# Altium schematic sheet LED_Section.SchDoc
size A4
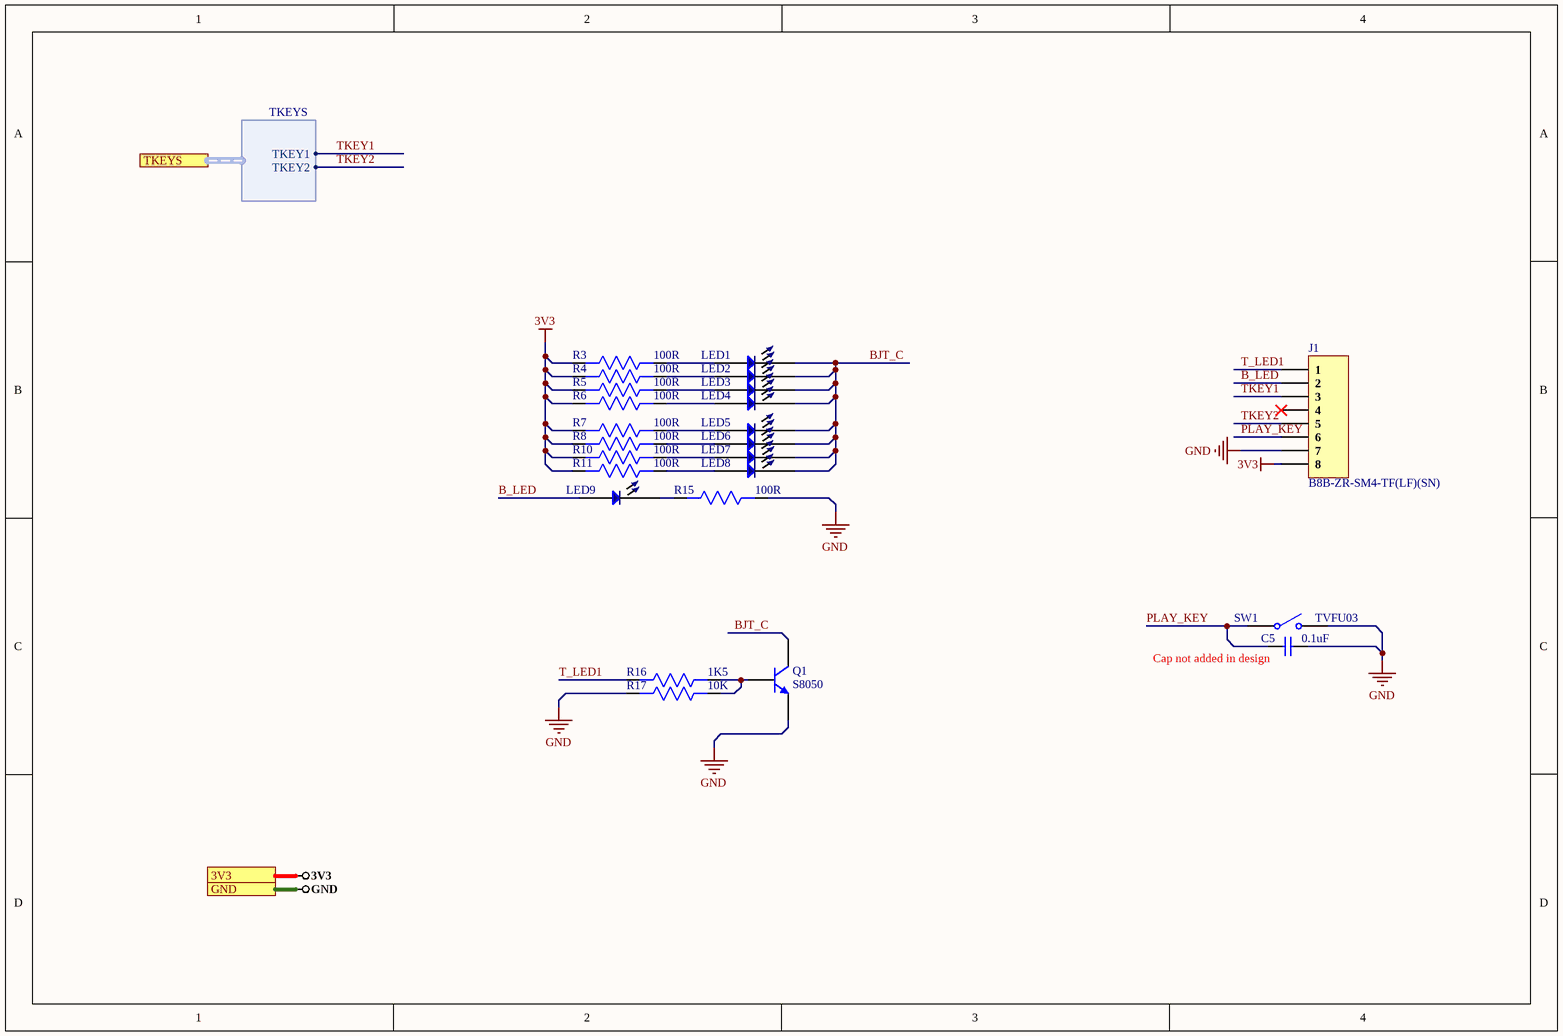
[diagram p0: LED_Section.SchDoc]

## Parts
C5  0.1uF  [Cap0805]
J1  B8B-ZR-SM4-TF(LF)(SN)  [B8B-ZR-SM4-TF(LF)(SN)]
LED1  150080GS75000  [LED 0805]  (value not drawn)
LED2  150080GS75000  [LED 0805]  (value not drawn)
LED3  150080GS75000  [LED 0805]  (value not drawn)
LED4  150080GS75000  [LED 0805]  (value not drawn)
LED5  150080GS75000  [LED 0805]  (value not drawn)
LED6  150080GS75000  [LED 0805]  (value not drawn)
LED7  150080GS75000  [LED 0805]  (value not drawn)
LED8  150080GS75000  [LED 0805]  (value not drawn)
LED9  150080GS75000  [LED 0805]  (value not drawn)
Q1  S8050  [sot-23]
R3  100R  [RES 0805]
R4  100R  [RES 0805]
R5  100R  [RES 0805]
R6  100R  [RES 0805]
R7  100R  [RES 0805]
R8  100R  [RES 0805]
R10  100R  [RES 0805]
R11  100R  [RES 0805]
R15  100R  [RES 0805]
R16  1K5  [RES 0805]
R17  10K  [RES 0805]
SW1  TVFU03  [TVFU03]

## Ports
3V3, GND, TKEYS (harness TKEYS)

## Harnesses
TKEYS: TKEY1, TKEY2

## Nets
3V3: J1.8 R3.2 R4.2 R5.2 R6.2 R7.2 R8.2 R10.2 R11.2 ; port 3V3
GND: C5.2 J1.7 Q1.2(E) R15.1 R17.2 SW1.2 ; port GND
B_LED: J1.2 LED9.1
BJT_C: LED1.2 LED2.2 LED3.2 LED4.2 LED5.2 LED6.2 LED7.2 LED8.2 Q1.3(C)
PLAY_KEY: C5.1 J1.6 SW1.1
T_LED1: J1.1 R16.2
TKEY1: J1.3 ; port TKEYS.TKEY1
TKEY2: J1.5 ; port TKEYS.TKEY2
NetLED1_1: LED1.1 R3.1
NetLED2_1: LED2.1 R4.1
NetLED3_1: LED3.1 R5.1
NetLED4_1: LED4.1 R6.1
NetLED5_1: LED5.1 R7.1
NetLED6_1: LED6.1 R8.1
NetLED7_1: LED7.1 R10.1
NetLED8_1: LED8.1 R11.1
NetLED9_2: LED9.2 R15.2
NetQ1_1: Q1.1(B) R16.1 R17.1

Not connected (* = marked no-connect by the designer): J1 4*

## Notes on the sheet
- (near C5) Cap not added in design

## Library data of the parts
C5 = 0805B104K500CT: CAP CER 0.1UF 50V X7R 0805; Manufacturer: Walsin Technologies; Tolerance: 10%; Capacitance: 100nF; Supplier 1: Digi-Key; Manufacturer Part Number: 0805B104K500CT; RoHS: Yes; Category: Ceramic Capacitors; Stock 1: 1274242; Pricing 1: 1=0.12000, 10=0.08600, 50=0.04900, 100=0.04050, 500=0.02842, 1000=0.02352 (USD); Case/Package: 0805; Case Code (Imperial): 0805; Case Code (Metric): 2012; Min Operating Temperature: -55°C; Max Operating Temperature: 125°C; Packaging: Tape and Reel; Voltage Rating: 50V; Dielectric: X7R; Voltage Rating (DC): 50V; Voltage: 50V; Length: 2mm; Depth: 1.25mm; Radiation Hardening: No; REACH SVHC: Unknown; Lead Free: Lead Free; ComponentLink1URL: http://www.farnell.com/datasheets/2340522.pdf?src-supplier=Farnell; ComponentLink1Description: http://www.farnell.com/datasheets/2340522.pdf?src-supplier=Farnell; ComponentLink2URL: http://components.arrow.com/part/dataview/0323_00650840?src-supplier=Arrow+Europe; ComponentLink2Description: http://components.arrow.com/part/dataview/0323_00650840?src-supplier=Arrow+Europe; ComponentLink3URL: https://www.verical.com/server-webapp/html/getDatasheet?partID=414849&src-supplier=Verical; ComponentLink3Description: https://www.verical.com/server-webapp/html/getDatasheet?partID=414849&src-supplier=Verical; ComponentLink4URL: http://www.farnell.com/datasheets/2340522.pdf?src-supplier=Element14; ComponentLink4Description: http://www.farnell.com/datasheets/2340522.pdf?src-supplier=Element14; ComponentLink5URL: http://www.passivecomponent.com/wp-content/uploads/2018/10/MLCC.pdf?src-supplier=Digi-Key; ComponentLink5Description: http://www.passivecomponent.com/wp-content/uploads/2018/10/MLCC.pdf?src-supplier=Digi-Key; ComponentLink6URL: http://www.passivecomponent.com/indexsea/0805B104K500CT-IB.pdf?src-supplier=Digi-Key; ComponentLink6Description: http://www.passivecomponent.com/indexsea/0805B104K500CT-IB.pdf?src-supplier=Digi-Key; ComponentLink7URL: http://www.farnell.com/datasheets/2340522.pdf?src-supplier=Newark; ComponentLink7Description: http://www.farnell.com/datasheets/2340522.pdf?src-supplier=Newark; Supplier Part Number 1: 1292-1647-1-ND
J1 = B8B-ZR-SM4-TF(LF)(SN): Conn Shrouded Header HDR 8 POS 1.5mm Solder ST SMD T/R; Manufacturer: JST; Number of Positions: 8; Connector Type: Male Pin; Current Rating: 1A; Gender: Male; Contact Resistance: 30mR; Max Voltage Rating (AC): 50V; Supplier 1: Digi-Key; Manufacturer Part Number: B8B-ZR-SM4-TF(LF)(SN); RoHS: Yes; Category: Board to Board Connectors; Pricing 1: 1=0.80000, 10=0.70700, 100=0.60970, 500=0.49886 (USD); Mount: Surface Mount; Contact Plating: Tin,Copper; Contact Material: Tin,Brass; Color: Natural; Housing Color: Beige; Housing Material: Polyamide; Min Operating Temperature: -25°C; Max Operating Temperature: 85°C; Number of Rows: 1; Packaging: Tape and Reel; Termination: Solder; Number of Contacts: 8; Max Current Rating: 1A; Fastening Type: Detent; Orientation: Right Angle; Length: 15mm; Width: 3.5mm; Height: 7.2mm; Pitch: 1.5mm; Depth: 6.5mm; Lead Free: Lead Free; ComponentLink1URL: https://datasheet.ciiva.com/26894/getdatasheetpartid-640747-26894507.pdf?src-supplier=Verical; ComponentLink1Description: https://datasheet.ciiva.com/26894/getdatasheetpartid-640747-26894507.pdf?src-supplier=Verical; ComponentLink2URL: https://datasheet.ciiva.com/16418/ezr-16418253.pdf?src-supplier=Future+Electronics; ComponentLink2Description: https://datasheet.ciiva.com/16418/ezr-16418253.pdf?src-supplier=Future+Electronics; Supplier Part Number 1: 455-1687-1-ND
LED1-LED9 = 150080GS75000: LED GREEN CLEAR 0805 SMD; Manufacturer: Wurth Electronics; Viewing Angle: 140°; Lens Style: Clear,Rectangular; Luminous Intensity: 450mcd; Forward Voltage: 3.2V; Wavelength: 520nm; Forward Current: 30mA; Test Current: 20mA; Supplier 1: Digi-Key; Manufacturer Part Number: 150080GS75000; RoHS: Yes; Category: LEDs; Stock 1: 96823; Pricing 1: 1=0.18000, 50=0.16500, 100=0.14200, 500=0.12300 (USD); Mount: Surface Mount; Case/Package: 0805; Color: Green; Case Code (Metric): 2012; Case Code (Imperial): 0805; Min Operating Temperature: -40°C; Max Operating Temperature: 85°C; Package Quantity: 4000; Packaging: Cut Tape; Dominant Wavelength: 520nm; Length: 2mm; Width: 1.25mm; Height: 0.7mm; REACH SVHC: Unknown; RoHS Compliant: Yes; ComponentLink1URL: https://datasheet.ciiva.com/29563/150080gs75000-29563008.pdf?src-supplier=Digi-Key; ComponentLink1Description: https://datasheet.ciiva.com/29563/150080gs75000-29563008.pdf?src-supplier=Digi-Key; ComponentLink2URL: https://datasheet.ciiva.com/29279/759434-da-01-en-chipled-0805-w-kl-gruen-150080gs75000-29279039.pdf?src-supplier=Conrad; ComponentLink2Description: https://datasheet.ciiva.com/29279/759434-da-01-en-chipled-0805-w-kl-gruen-150080gs75000-29279039.pdf?src-supplier=Conrad; Supplier Part Number 1: 732-4983-1-ND
Q1 = S8050: NPN 500mA 25V 300mW SOT-23(SOT-23-3) Bipolar Transistors - BJT RoHS; Manufacturer: Shikues; Package: SOT-23(SOT-23-3); Transistor Type: NPN; Current - Collector (Ic) (Max): 500mA; Voltage - Collector Emitter Breakdown (Max): 25V; Power-max: 300mW
R3-R8 R10 R11 R15 = ERA6VEB1000V: Res SMD 100 Ohm 0.10% 1/8W 0805; Manufacturer: Panasonic; Manufacturer Part Number: ERA-6VEB1000V; Supplier 1: Digi-Key; RoHS: No; Category: Chip SMD Resistors; Stock 1: 2703; Pricing 1: 1=0.56000, 10=0.46700, 100=0.31350, 1000=0.18342, 2500=0.18142 (USD); Supplier Part Number 1: 10-ERA-6VEB1000VCT-ND
R16 = RC0805JR-071K5L: RES SMD 1K5 0.125W ±5% 0805; Manufacturer: Yageo; Resistance: 1.5kR; Temperature Coefficient: 100ppm/°C; Power Rating: 125mW; Voltage Rating: 150V; Supplier 1: Future Electronics; Manufacturer Part Number: RC0805JR-071K5L; RoHS: Yes; Category: Chip SMD Resistors; Stock 1: 115000; Pricing 1: 5000=0.00390, 20000=0.00330, 75000=0.00320, 125000=0.00320, 250000=0.00310 (USD); Case/Package: 0805; Contact Plating: Tin,Matte,Lead; Case Code (Imperial): 0805; Case Code (Metric): 2012; Size Code: 0805; Min Operating Temperature: -55°C; Max Operating Temperature: 155°C; Tolerance: 5%; Resistor Type: Thick Film; Packaging: Tape and Reel; Package Quantity: 1; Termination: SMD/SMT; Number of Terminations: 2; Max Power Dissipation: 125mW; Features: Moisture Resistant; Series: RC; Resistance Tolerance: 5%; Construction: Rectangular; Length: 0.079inch; Width: 0.049inch; Height: 0.024inch; Depth: 1.25mm; Radiation Hardening: No; REACH SVHC: Unknown; Military Standard: Not; Lead Free: Lead Free; RoHS Compliant: Yes; ComponentLink1URL: https://datasheet.ciiva.com/2456/pyu-r-int-thick-7-2456073.pdf?src-supplier=Digi-Key; ComponentLink1Description: https://datasheet.ciiva.com/2456/pyu-r-int-thick-7-2456073.pdf?src-supplier=Digi-Key; ComponentLink2URL: https://datasheet.ciiva.com/2456/pyu-r-int-thick-7-2456074.pdf?src-supplier=Digi-Key; ComponentLink2Description: https://datasheet.ciiva.com/2456/pyu-r-int-thick-7-2456074.pdf?src-supplier=Digi-Key; ComponentLink3URL: https://datasheet.ciiva.com/17026/rc0805-17026842.pdf?src-supplier=Future+Electronics; ComponentLink3Description: https://datasheet.ciiva.com/17026/rc0805-17026842.pdf?src-supplier=Future+Electronics; ComponentLink4URL: https://datasheet.ciiva.com/46395/444164-46395130.pdf?src-supplier=Element14; ComponentLink4Description: https://datasheet.ciiva.com/46395/444164-46395130.pdf?src-supplier=Element14; ComponentLink5URL: https://datasheet.ciiva.com/2456/pyu-r-int-thick-7-2456075.pdf?src-supplier=Digi-Key; ComponentLink5Description: https://datasheet.ciiva.com/2456/pyu-r-int-thick-7-2456075.pdf?src-supplier=Digi-Key; Supplier Part Number 1: 1655711
R17 = RMCF0805FT10K0: RES 10K OHM 1% 1/8W 0805; Manufacturer: Stackpole Electronics; Resistance: 10kR; Power Rating: 125mW; Temperature Coefficient: 100ppm/°C; Supplier 1: Digi-Key; Manufacturer Part Number: RMCF0805FT10K0; RoHS: Yes; Category: Chip SMD Resistors; Stock 1: 308321; Pricing 1: 1=0.10000, 10=0.02700, 100=0.01090, 1000=0.00488, 2500=0.00423 (USD); Mount: Surface Mount; Case/Package: 0805; Case Code (Metric): 2012; Case Code (Imperial): 0805; Contact Plating: Tin,Matte; Size Code: 0805; Min Operating Temperature: -55°C; Max Operating Temperature: 155°C; Tolerance: 1%; Packaging: Tape and Reel; Resistor Type: Thick Film; Number of Terminations: 2; Max Power Dissipation: 125mW; Features: Automotive AEC-Q200; Series: RMCF; Construction: Rectangular; Length: 2mm; Width: 0.049inch; Height: 0.026inch; Depth: 1.25mm; Radiation Hardening: No; Lead Free: Lead Free; Military Standard: Not; RoHS Compliant: Yes; ComponentLink1URL: https://datasheet.ciiva.com/15193/getdatasheetpartid-362046-15193525.pdf?src-supplier=Verical; ComponentLink1Description: https://datasheet.ciiva.com/15193/getdatasheetpartid-362046-15193525.pdf?src-supplier=Verical; Supplier Part Number 1: RMCF0805FT10K0CT-ND
SW1 = TVFU03: 6mm 2 pin smd soft touch long travel silent tact switch; Manufacturer: Zhejiang, China; Value: Custom; Manufacturer Part No: TVFU03; Package: Custom; ComponentLink1Description: Supplier Link; ComponentLink1URL: https://www.alibaba.com/product-detail/6mm-2-pin-smd-soft-touch_324641074.html